# Altium schematic sheet SD_FMU.SchDoc
size A4; SheetNumber: 2; SheetTotal: 5
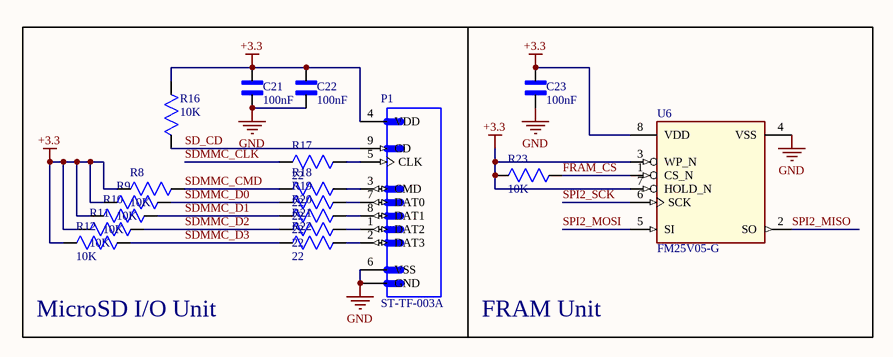
[diagram p0: SD_FMU.SchDoc]

## Parts
C21  100nF  [CAPC1608X90N]
C22  100nF  [CAPC1608X90N]
C23  100nF  [CAPC1608X90N]
P1  ST-TF-003A  [SUNTECH_ST-TF-003A]
R8  10K  [RESC2013X65N]
R9  10K  [RESC2013X65N]
R10  10K  [RESC2013X65N]
R11  10K  [RESC2013X65N]
R12  10K  [RESC2013X65N]
R16  10K  [RESC2013X65N]
R17  22  [RESC2013X65N]
R18  22  [RESC2013X65N]
R19  22  [RESC2013X65N]
R20  22  [RESC2013X65N]
R21  22  [RESC2013X65N]
R22  22  [RESC2013X65N]
R23  10K  [RESC2013X65N]
U6  FM25V05-G  [SOIC127P602X173-8N-1-V]

## Blocks framed on the sheet
MicroSD I/O Unit: C21 C22 P1 R8-R12 R16-R22
FRAM Unit: C23 R23 U6

## Nets
+3.3: C21.2 C22.2 C23.2 P1.4(VDD) R8.1(R1) R9.1(R1) R10.1(R1) R11.1(R1) R12.1(R1) R16.2(R2) R23.1(R1) U6.3(WP_N) U6.7(HOLD_N) U6.8(VDD)
GND: C21.1 C22.1 C23.1 P1.6(VSS) P1.G1(GND) P1.G2(GND) P1.G3(GND) P1.G4(GND) U6.4(VSS)
FRAM_CS: R23.2(R2) U6.1(CS_N)
SD_CD: P1.9(CD) R16.1(R1)
SDMMC_CLK: R17.1(R1)
SDMMC_CMD: R8.2(R2) R18.1(R1)
SDMMC_D0: R9.2(R2) R19.1(R1)
SDMMC_D1: R10.2(R2) R20.1(R1)
SDMMC_D2: R11.2(R2) R21.1(R1)
SDMMC_D3: R12.2(R2) R22.1(R1)
SPI2_MISO: U6.2(SO)
SPI2_MOSI: U6.5(SI)
SPI2_SCK: U6.6(SCK)
NetP1_1: P1.1(DAT2) R21.2(R2)
NetP1_2: P1.2(DAT3) R22.2(R2)
NetP1_3: P1.3(CMD) R18.2(R2)
NetP1_5: P1.5(CLK) R17.2(R2)
NetP1_7: P1.7(DAT0) R19.2(R2)
NetP1_8: P1.8(DAT1) R20.2(R2)

## Library data of the parts
C21-C23 = GRM188R71H104KA93D: SMD Capacitor X7R(EIA) with Capacitance: 0.10uF Tol. 10%. Rated Voltage: 50Vdc; MF: Murata; SnapEDA_Link: https://www.snapeda.com/parts/GRM188R71H104KA93D/Murata/view-part/?ref=snap; Package: 1608 Murata; Value: *; MP: GRM188R71H104KA93D; Check_prices: https://www.snapeda.com/parts/GRM188R71H104KA93D/Murata/view-part/?ref=eda
P1 = ST-TF-003A: Micro SD Card Socket; Price: None; MP: ST-TF-003A; Availability: Unavailable; Value: *; Package: None
R8-R12 R16-R23 = RC0805FR-075K1L: 5.1 kOhms Â±1% 0.125W, 1/8W Chip Resistor 0805 (2012 Metric) Moisture Resistant Thick Film; MF: Yageo; MP: RC0805FR075K1L; SnapEDA_Link: https://www.snapeda.com/parts/RC0805FR075K1L/Yageo/view-part/?ref=snap; Package: 0805-2 YAGEO; Value: *; Check_prices: https://www.snapeda.com/parts/RC0805FR075K1L/Yageo/view-part/?ref=eda
U6 = FM25V05-G: 4-Kbit (512 × 8) Serial (SPI) F-RAM; Manufacturer: Infineon Technologies; PackageReference: PG-DSO-8-802; Manufacturer Order Number: FM25V05-G